# Altium schematic sheet 10_Boot_Cfg.SchDoc
size A3; SheetNumber: 11; SheetTotal: 13
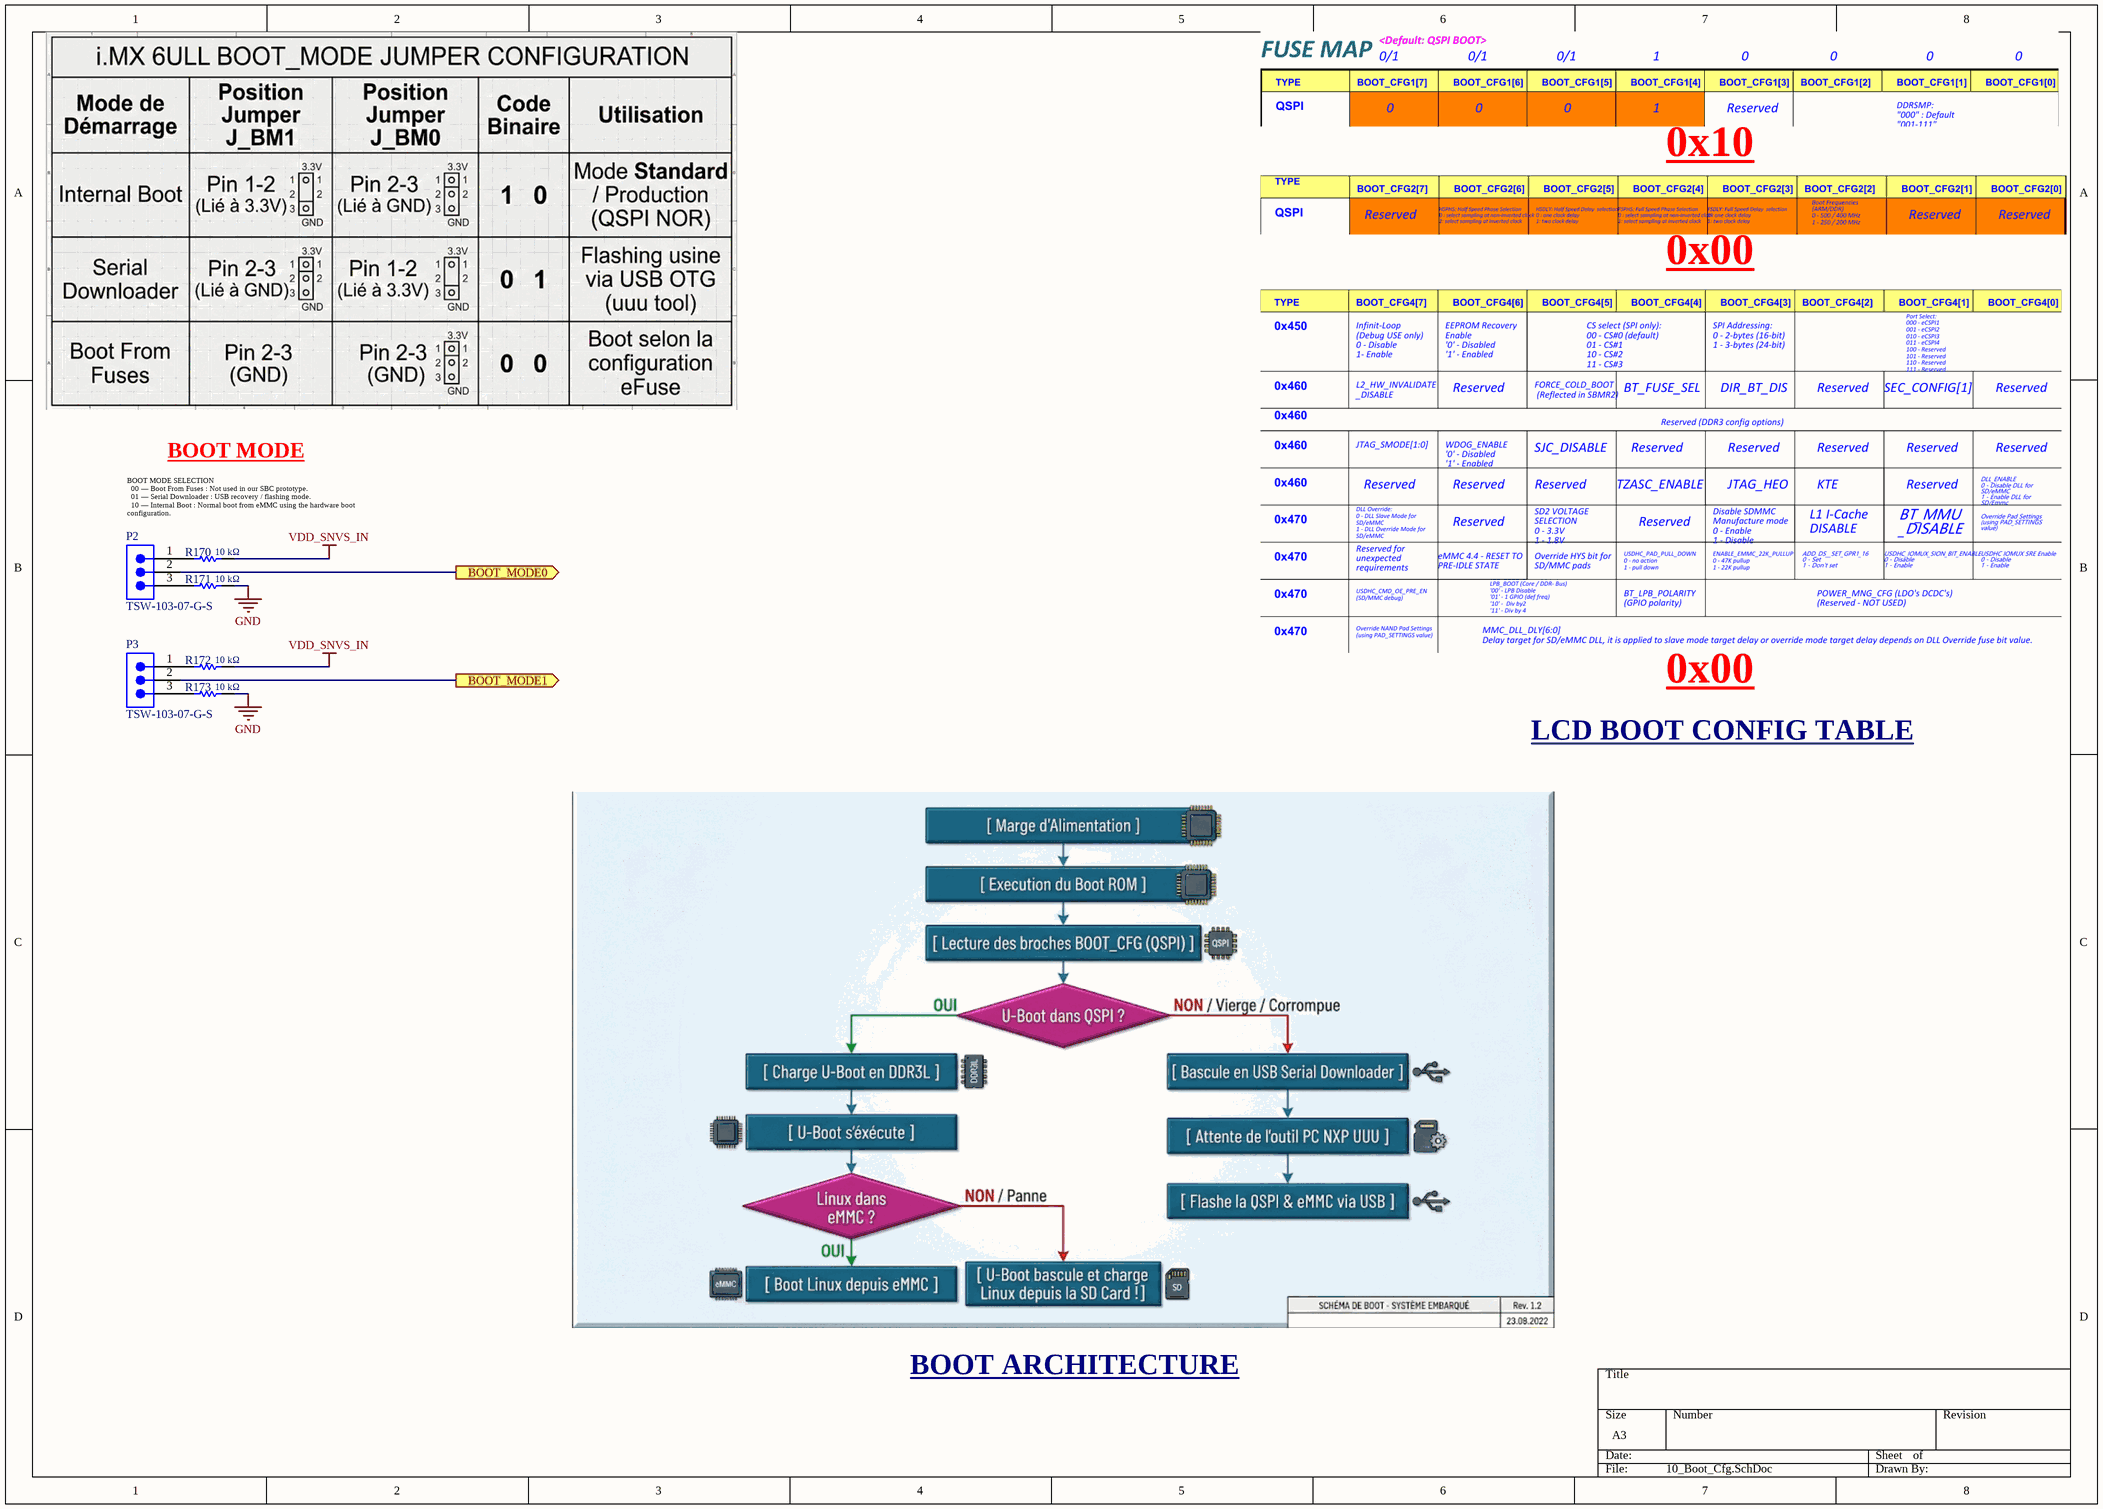
[diagram p0: 10_Boot_Cfg.SchDoc]

## Parts
P2  TSW-103-07-G-S  [SMTC-TSW-103-07-X-S]
P3  TSW-103-07-G-S  [SMTC-TSW-103-07-X-S]
R170  10 kΩ  [RESC1608X55X25ML10T15]
R171  10 kΩ  [RESC1608X55X25ML10T15]
R172  10 kΩ  [RESC1608X55X25ML10T15]
R173  10 kΩ  [RESC1608X55X25ML10T15]

## Ports
BOOT_MODE0 (out), BOOT_MODE1 (out)

## Nets
GND: R171.1 R173.1
VDD_SNVS_IN: R170.1 R172.1
BOOT_MODE0: P2.2 ; port BOOT_MODE0
BOOT_MODE1: P3.2 ; port BOOT_MODE1
NetP2_1: P2.1 R170.2
NetP2_3: P2.3 R171.2
NetP3_1: P3.1 R172.2
NetP3_3: P3.3 R173.2

## Notes on the sheet
- 0x10
- 0x00
- BOOT MODE SELECTION
  00 — Boot From Fuses : Not used in our SBC prototype.
  01 — Serial Downloader : USB recovery / flashing mode.
  10 — Internal Boot : Normal boot from eMMC using the hardware boot configuration.
  11 — Not used.
- BOOT MODE
- LCD BOOT CONFIG TABLE
- BOOT ARCHITECTURE

## Library data of the parts
P2 P3 = CMP-1024-00333-1: 0.025" SQ Post Header, Through-hole, Vertical, -55 to 125 degC, 2.54 mm Pitch, 3-Pin, Male, RoHS; Manufacturer: Samtec; Pitch: 2.54 mm; ComponentLink3URL: http://www.samtec.com/documents/webfiles/cpdf/TSW-XXX-XX-XXX-X-XX-XXX-MKT.pdf; Temperature Range: -55 to 125 degC; DatasheetVersion: F-214; ComponentLink1Description: Manufacturer URL; ComponentLink2URL: http://www.samtec.com/documents/webfiles/pdf/TSW_TH.PDF; RoHS: True; Orientation: Vertical; ComponentLink2Description: Datasheet; ComponentLink3Description: Package Specification; PackageDescription: .025[0.64] SQ. Post Terminal Strip Assembly; Mounting Technology: Through-hole; PackageVersion: DM, 8/1988; ComponentLink1URL: http://www.samtec.com; PackageReference: TSW-103-07-X-S; PartNumber: TSW-103-07-G-S
R170-R173 = CMP-2000-05022-1: Resistor, 10 KOhm, +/- 5%, 100 mW, -55 to 155 degC, 0603 (1608 Metric), RoHS, Tape and Reel; Manufacturer: Yageo; Resistance: 10kOhms; Voltage Rating: 50V; Temperature Coefficient: 100PPM/C; Power Rating: 100mW; Package Reference: 603; Series: RC; Case Code - mm: 1608; Packaging: Reel; Datasheet URL: http://www.farnell.com/datasheets/443971.pdf; Datasheet Version: Rev. 4, 04/2009; Operating Temperature Range: -55Cto+155C; Product: ThickFilmResistorsGeneralPurpose; Package Description: 2-Pin Surface Mount Device, Body 1.6 x 0.8 mm; Manufacturer URL: http://www.yageo.com/; Case Code - in: 0603; Tolerance: 5%; Termination Style: SMD/SMT